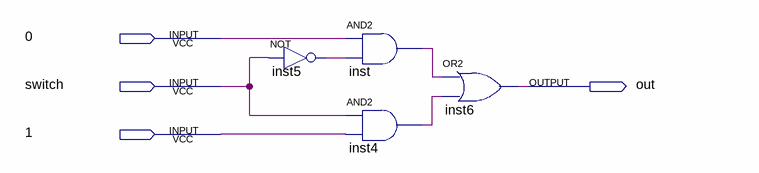
[diagram p0: schematic sheet]
// Quartus schematic mux.bdf as structural Verilog: 4 symbols, 4 pins
module mux (
  input  \0 ,
  input  switch,
  input  \1 ,
  output out
);

  wire inst4_out, inst5_out, inst_out;

  not inst5 (inst5_out, switch);
  and inst (inst_out, \0 , inst5_out);
  and inst4 (inst4_out, switch, \1 );
  or inst6 (out, inst_out, inst4_out);
endmodule
